# Altium schematic sheet Sheet1.SchDoc
size 381 x 241 mm; SheetNumber: 1; SheetTotal: 1
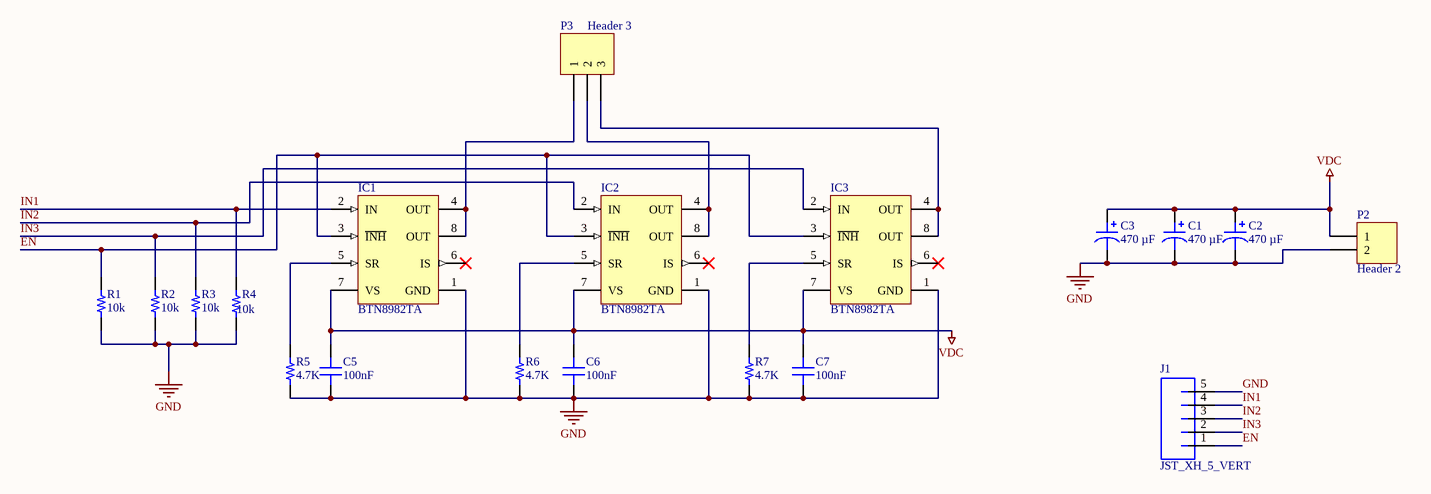
[diagram p0: Sheet1.SchDoc]

## Parts
C1  470 µF  [CAP TH ALPOLY D10.00mm S5.00mm H11.50mm]
C2  470 µF  [CAP TH ALPOLY D10.00mm S5.00mm H11.50mm]
C3  470 µF  [CAP TH ALPOLY D10.00mm S5.00mm H11.50mm]
C5  Capacitance: 100nF  [CAP 0805_2012]  (hidden comment: 10000 pF)
C6  Capacitance: 100nF  [CAP 0805_2012]  (hidden comment: 10000 pF)
C7  Capacitance: 100nF  [CAP 0805_2012]  (hidden comment: 10000 pF)
IC1  BTN8982TA  [INF-PG-TO263-7-1_L]
IC2  BTN8982TA  [INF-PG-TO263-7-1_L]
IC3  BTN8982TA  [INF-PG-TO263-7-1_L]
J1  JST_XH_5_VERT  [JST-XH-5-PTH-VERT]
P2  Header 2  [HDR1X2]
P3  Header 3  [HDR1X3]
R1  10k  [RES 0805_2012]
R2  10k  [RES 0805_2012]
R3  10k  [RES 0805_2012]
R4  10k  [RES 0805_2012]
R5  4.7K  [RES 0805_2012]
R6  4.7K  [RES 0805_2012]
R7  4.7K  [RES 0805_2012]

## Nets
GND: C1.2 C2.2 C3.2 C5.1 C6.1 C7.1 IC1.1(GND) IC2.1(GND) IC3.1(GND) J1.5 P2.2 R1.1 R2.1 R3.1 R4.1 R5.1 R6.1 R7.1
VDC: C1.1 C2.1 C3.1 C5.2 C6.2 C7.2 IC1.7(VS) IC2.7(VS) IC3.7(VS) P2.1
EN: IC1.3(~{INH}) IC2.3(~{INH}) IC3.3(~{INH}) J1.1 R1.2
IN1: IC1.2(IN) J1.4 R4.2
IN2: IC2.2(IN) J1.3 R3.2
IN3: IC3.2(IN) J1.2 R2.2
NetIC1_4: IC1.4(OUT) IC1.8(OUT) P3.1
NetIC1_5: IC1.5(SR) R5.2
NetIC2_4: IC2.4(OUT) IC2.8(OUT) P3.2
NetIC2_5: IC2.5(SR) R6.2
NetIC3_4: IC3.4(OUT) IC3.8(OUT) P3.3
NetIC3_5: IC3.5(SR) R7.2

Not connected (* = marked no-connect by the designer): IC1 6(IS)*; IC2 6(IS)*; IC3 6(IS)*

## Library data of the parts
C1-C3 = APSC160ELL471MJB5S: CAP ALUM POLY 470UF 20% 16V T/H; manufacturer: United Chemi-Con; ESR (Equivalent Series Resistance): 10mOhm; Lifetime @ Temp.: 2000 Hrs @ 105°C; Ripple Current @ High Frequency: 6.1 A @ 100 kHz; Type: Polymer; Part Number: APSC160ELL471MJB5S; Value: 470 µF; Applications: General Purpose; Capacitance: 470 µF; componentlink1description: Datasheet; componentlink1url: http://www.chemi-con.co.jp/cgi-bin/CAT_DB/SEARCH/cat_db_al.cgi?e=e&j=p&pdfname=psc; componentlink2description: DigiKey Link; componentlink2url: https://www.digikey.com/en/products/detail/united-chemi-con/APSC160ELL471MJB5S/1826698; Device Package: Radial, Can; Height - Seated (Max): 0.453" (11.50mm); lastupdated: 4/5/2026 21:04:37; Lead Spacing: 0.197" (5.00mm); Lifecycle Status: Active; Minimum Order: 1; Mounting Type: Through Hole; Operating Temperature: -55°C ~ 105°C; Package / Case: Radial, Can; packaging: Bulk; partid: 3587; Part Status: Active; price: 0.89; series: NPCAP™-PSC; Size / Dimension: 0.394" Dia (10.00mm); Supplier 1: DigiKey; Supplier Part Number 1: 565-3234-ND; Tolerance: ±20%; Voltage - Rated: 16 V
C5-C7 = C0805C103K5RACTU: CAP CER 10000PF 50V X7R 0805; manufacturer: KEMET; Tolerance: ±10%; Part Number: C0805C103K5RACTU; Applications: Bypass, Decoupling; componentlink1description: Datasheet; componentlink1url: https://api.kemet.com/component-edge/download/datasheet/C0805C103K5RACTU.pdf; componentlink2description: DigiKey Link; componentlink2url: https://www.digikey.com/en/products/detail/kemet/C0805C103K5RACTU/411157; Device Package: 0805 (2012 Metric); lastupdated: 4/6/2026 19:33:13; Lifecycle Status: Active; Minimum Order: 1; Mounting Type: Surface Mount, MLCC; Operating Temperature: -55°C ~ 125°C; Package / Case: 0805 (2012 Metric); packaging: TapeAndReel; partid: 74789; Part Status: Active; price: 0.01; series: SMD Comm X7R; Size / Dimension: 0.079" L x 0.049" W (2.00mm x 1.25mm); Supplier 1: DigiKey; Supplier Part Number 1: 399-C0805C103K5RACTUCT-ND; Temperature Coefficient: X7R; Thickness (Max): 0.035" (0.88mm); value: 10000 pF; Voltage - Rated: 50V
IC1-IC3 = CMP-1114-00014-1: High Current PN Half Bridge, 5.5 to 40 V, 7 uA Iq, PG-TO263-7, Reel, Green; Manufacturer: Infineon; Inhibit: TRUE; Iq (typ): 7 uA; Group: NovalithIC; ID(lim): 77 A; RDS (on): 10; Protect: UV, OT, OC; ID(lim) (min): 55 A; Diagnosis: OT, OC-failure flag, current sense; ComponentLink2Description: Datasheet; Packing: Reel; PackageDescription: 7-Pin Plastic (Green) Transistor Single Outline Package, 9.25 x 10 mm Body, 1.27 mm Pitch; PackageVersion: May-07; PackageReference: PG-TO263-7-1; ComponentLink2URL: http://www.infineon.com/dgdl/BTN8982TA-Data-Sheet-rev10-Infineon.pdf?folderId=db3a30431ff98815012060aedcd46179&fileId=db3a30433fa9412f013fbe32289b7c17; Operating Range: 5.5 to 40 V; ComponentLink1Description: Manufacturer URL; Green: TRUE; Mounting: SMT; PartNumber: BTN8982TA; ComponentLink3URL: http://www.infineon.com/dgdl/BTN8982TA-Data-Sheet-rev10-Infineon.pdf?folderId=db3a30431ff98815012060aedcd46179&fileId=db3a30433fa9412f013fbe32289b7c17&ack=t; ComponentLink1URL: http://www.infineon.com/; Halogen-free: TRUE; Mounting Technology: Surface Mount; ComponentLink3Description: Package Specification; DatasheetVersion: Rev. 1.0
J1 = JST_XH_5_VERT: Manufacturer: JST Sales America, Inc.; PartNumber: B5B-XH-A(LF)(SN); Mounting Technology: Through Hole; PackageReference: JST-XH
P2 = Header 2: Header, 2-Pin; LatestRevisionDate: 17-Jul-2002; LatestRevisionNote: Re-released for DXP Platform.; Publisher: Altium Limited
P3 = Header 3: Header, 3-Pin; LatestRevisionDate: 17-Jul-2002; LatestRevisionNote: Re-released for DXP Platform.; Publisher: Altium Limited
R1-R7 = CRGP0805F470R: RES 470 OHM 1% 1/3W 0805; Part Number: CRGP0805F470R